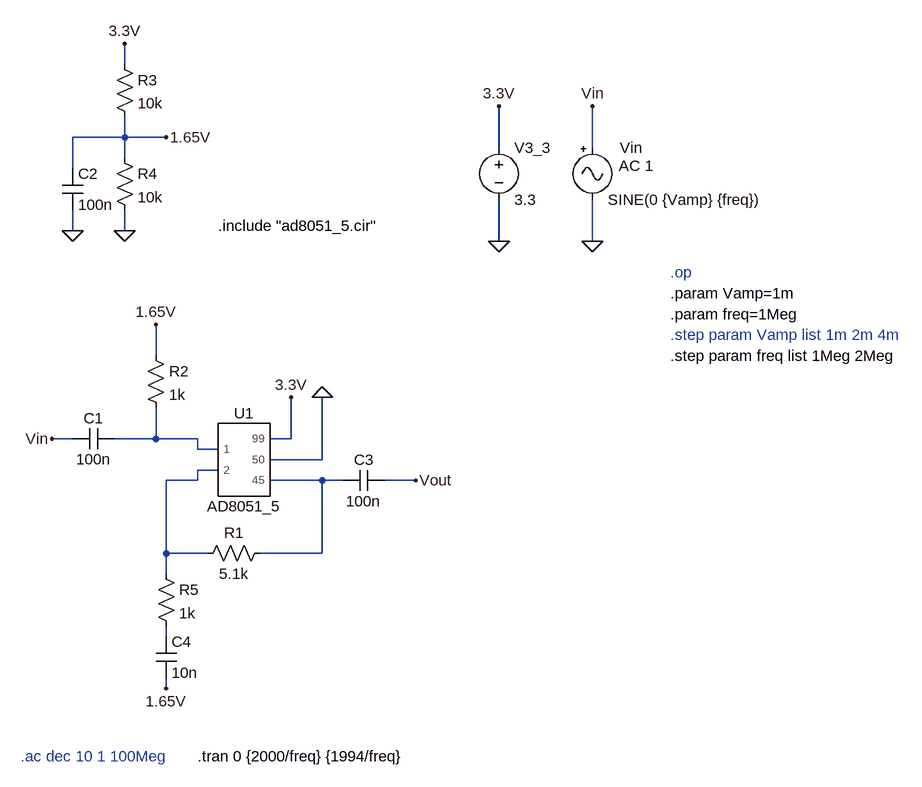
[diagram p0: schematic 1st_amp.asc]
1st_amp.asc, the LTspice schematic file:
Version 4.1
SHEET 1 1444 808
WIRE 0 -272 0 -304
WIRE 0 -160 0 -192
WIRE 0 -160 -80 -160
WIRE 64 -160 0 -160
WIRE 576 -144 576 -208
WIRE 720 -144 720 -208
WIRE 0 -128 0 -160
WIRE -80 -112 -80 -160
WIRE -80 -16 -80 -48
WIRE 0 -16 0 -48
WIRE 576 0 576 -64
WIRE 720 0 720 -64
WIRE 48 176 48 128
WIRE -80 304 -112 304
WIRE 48 304 48 256
WIRE 48 304 -16 304
WIRE 112 304 48 304
WIRE 256 304 256 240
WIRE 256 304 224 304
WIRE 112 320 112 304
WIRE 144 320 112 320
WIRE 304 336 304 240
WIRE 304 336 224 336
WIRE 144 352 112 352
WIRE 112 368 112 352
WIRE 112 368 64 368
WIRE 304 368 224 368
WIRE 336 368 304 368
WIRE 448 368 400 368
WIRE 64 480 64 368
WIRE 128 480 64 480
WIRE 304 480 304 368
WIRE 304 480 208 480
WIRE 64 512 64 480
WIRE 64 608 64 592
WIRE 64 688 64 672
FLAG 576 0 0
FLAG 720 0 0
FLAG 576 -208 3.3V
FLAG 720 -208 Vin
FLAG 256 240 3.3V
FLAG 0 -304 3.3V
FLAG 0 -16 0
FLAG -80 -16 0
FLAG 64 -160 1.65V
FLAG 48 128 1.65V
FLAG -112 304 Vin
FLAG 64 688 1.65V
FLAG 448 368 Vout
FLAG 304 240 0
SYMBOL res 224 464 R90
WINDOW 0 0 56 VBottom 2
WINDOW 3 32 56 VTop 2
SYMATTR InstName R1
SYMATTR Value 5.1k
SYMBOL cap -16 288 R90
WINDOW 0 0 32 VBottom 2
WINDOW 3 32 32 VTop 2
SYMATTR InstName C1
SYMATTR Value 100n
SYMBOL res 32 160 R0
SYMATTR InstName R2
SYMATTR Value 1k
SYMBOL voltage 576 -160 R0
WINDOW 123 0 0 Left 0
WINDOW 39 0 0 Left 0
SYMATTR InstName V3_3
SYMATTR Value 3.3
SYMBOL Misc\\signal 720 -160 R0
WINDOW 0 42 16 Left 2
WINDOW 123 41 44 Left 2
WINDOW 39 0 0 Left 0
SYMATTR InstName Vin
SYMATTR Value SINE(0 {Vamp} {freq})
SYMATTR Value2 AC 1
SYMBOL res -16 -288 R0
SYMATTR InstName R3
SYMATTR Value 10k
SYMBOL res -16 -144 R0
SYMATTR InstName R4
SYMATTR Value 10k
SYMBOL cap -96 -112 R0
SYMATTR InstName C2
SYMATTR Value 100n
SYMBOL res 48 496 R0
SYMATTR InstName R5
SYMATTR Value 1k
SYMBOL AD8051_5 176 336 R0
SYMATTR InstName U1
SYMBOL cap 400 352 R90
WINDOW 0 0 32 VBottom 2
WINDOW 3 32 32 VTop 2
SYMATTR InstName C3
SYMATTR Value 100n
SYMBOL cap 48 608 R0
SYMATTR InstName C4
SYMATTR Value 10n
TEXT 144 -24 Left 2 !.include "ad8051_5.cir"
TEXT 840 80 Left 2 !.param Vamp=1m
TEXT 840 112 Left 2 !.param freq=1Meg
TEXT 840 144 Left 2 ;.step param Vamp list 1m 2m 4m
TEXT 840 176 Left 2 !.step param freq list 1Meg 2Meg
TEXT -160 792 Left 2 ;.ac dec 10 1 100Meg
TEXT 112 792 Left 2 !.tran 0 {2000/freq} {1994/freq}
TEXT 840 48 Left 2 ;.op

The netlist it stands for:
* 1st_amp.asc
R1 N003 N002 5.1k
C1 N001 Vin 100n
R2 1.65V N001 1k
V3_3 3.3V 0 3.3
Vin Vin 0 SINE(0 {Vamp} {freq}) AC 1
R3 3.3V 1.65V 10k
R4 1.65V 0 10k
C2 1.65V 0 100n
R5 N002 N004 1k
X§U1 N001 N002 3.3V 0 N003 AD8051_5  ; pins 1 2 99 50 45
C3 Vout N003 100n
C4 N004 1.65V 10n
.include "ad8051_5.cir"
.param Vamp=1m
.param freq=1Meg
* .step param Vamp list 1m 2m 4m
.step param freq list 1Meg 2Meg
* .ac dec 10 1 100Meg
.tran 0 {2000/freq} {1994/freq}
* .op
.lib ad8051_5.cir
.backanno
.end